# EAGLE board 1700-0003_PowerBoard_REV-A (EAGLE 7.7.0)
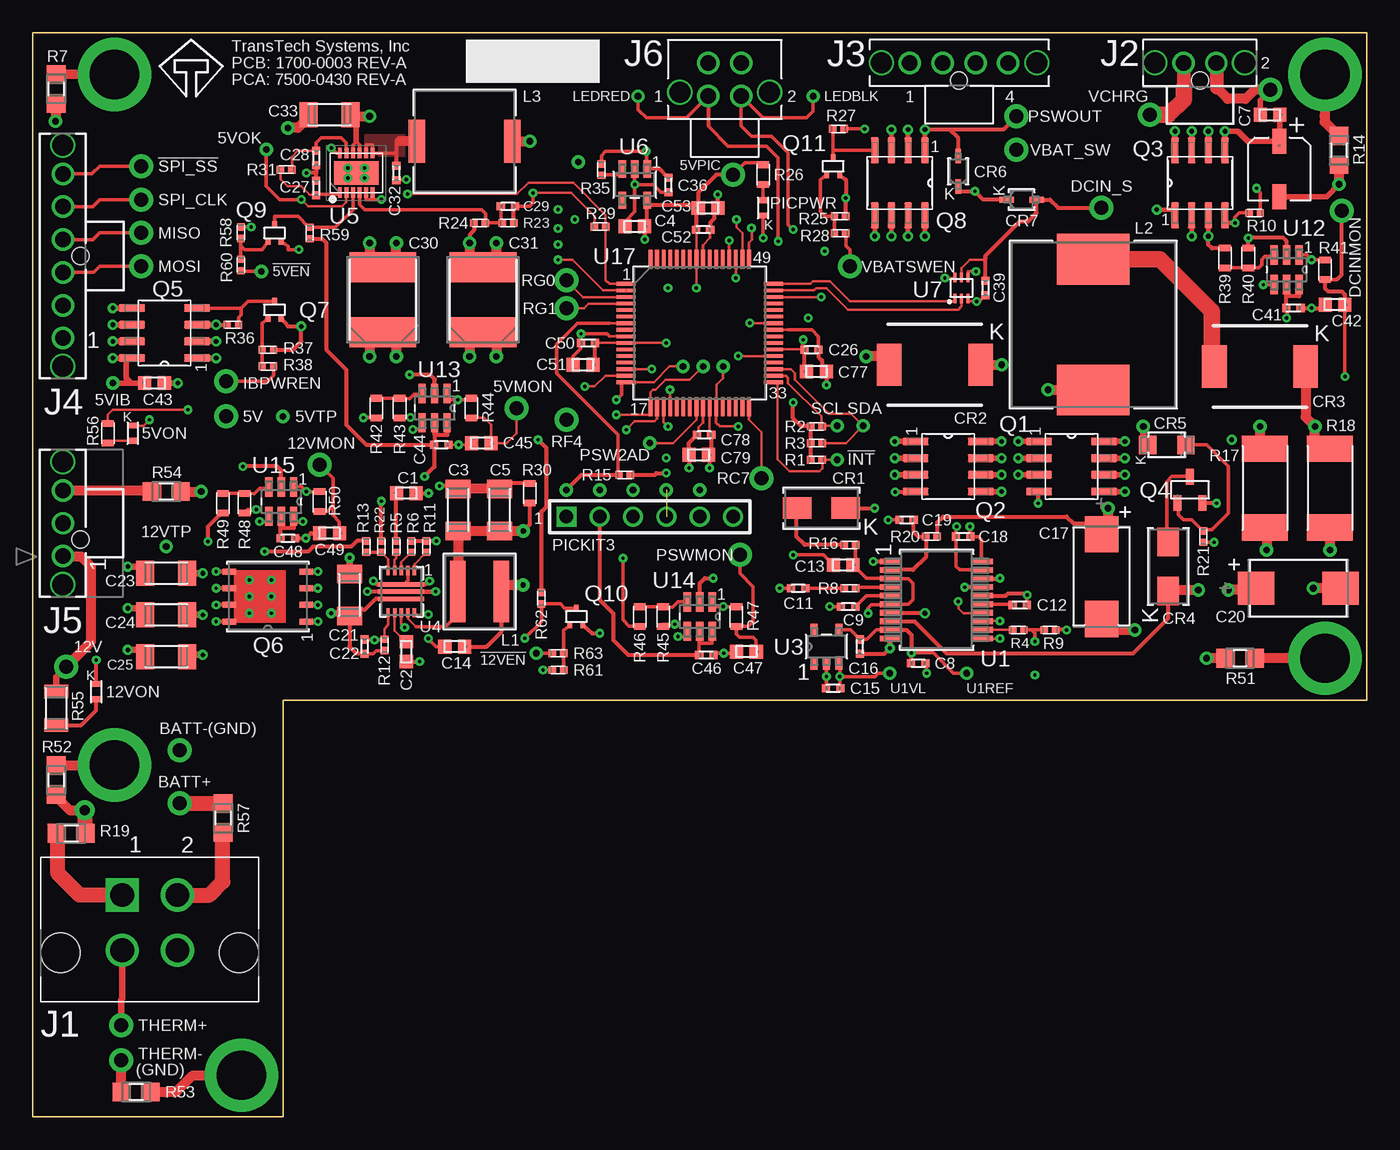
[diagram p7: board, top side]
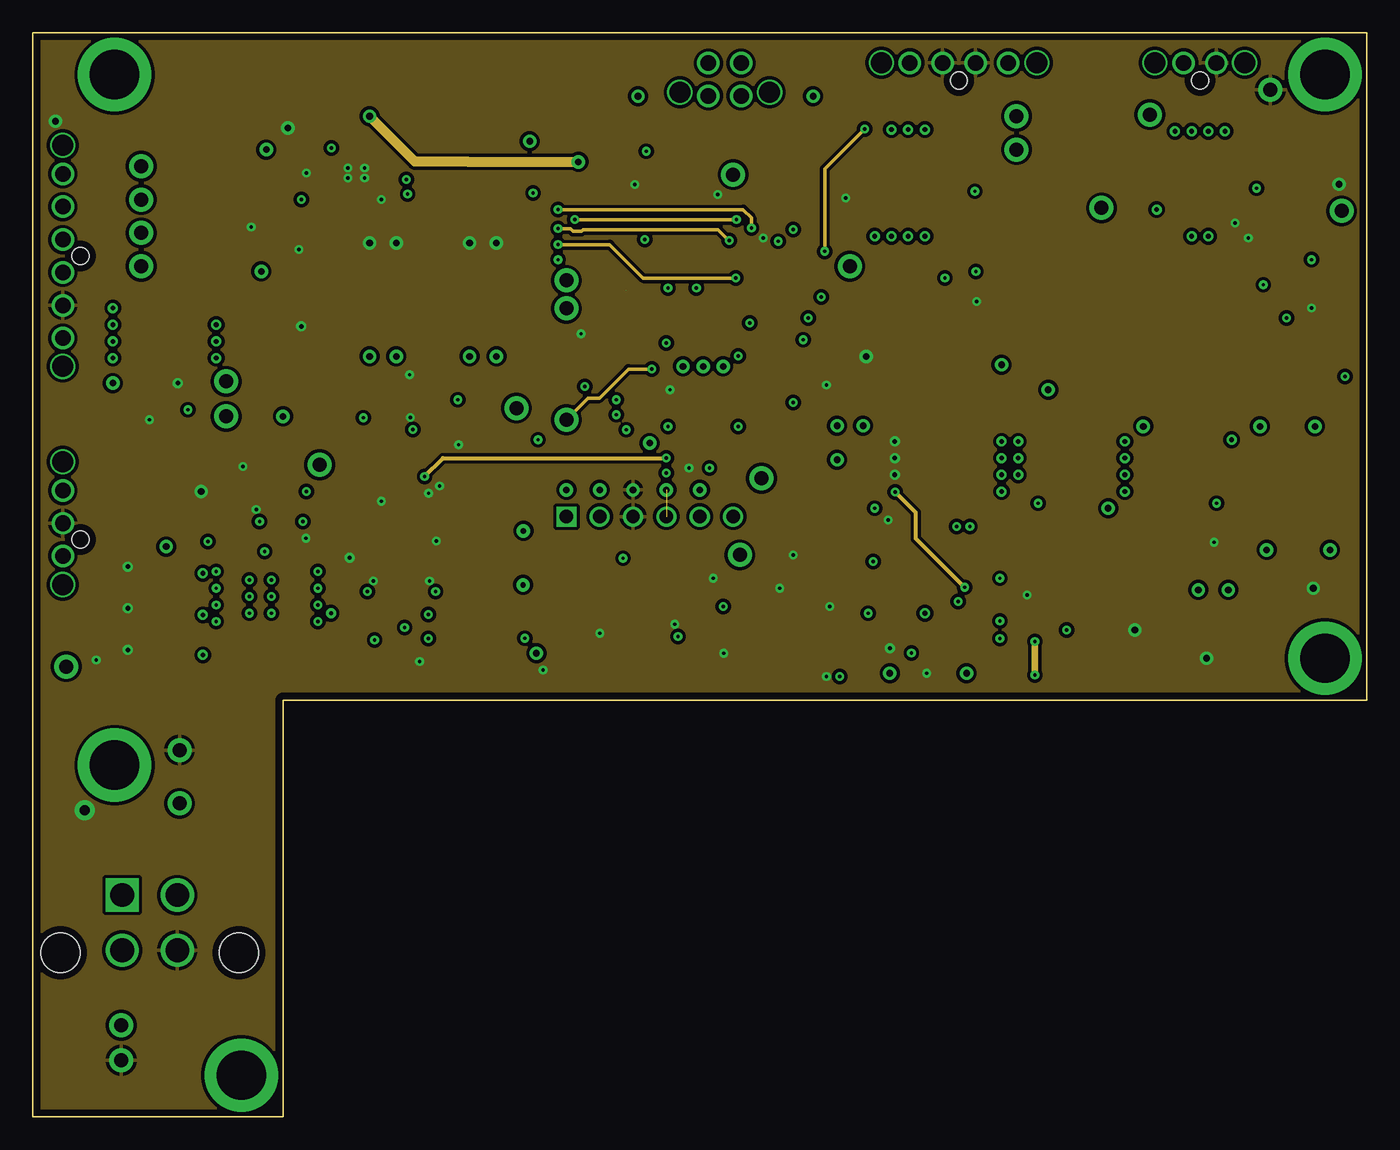
[diagram p8: board, inner layer GND+Signal]
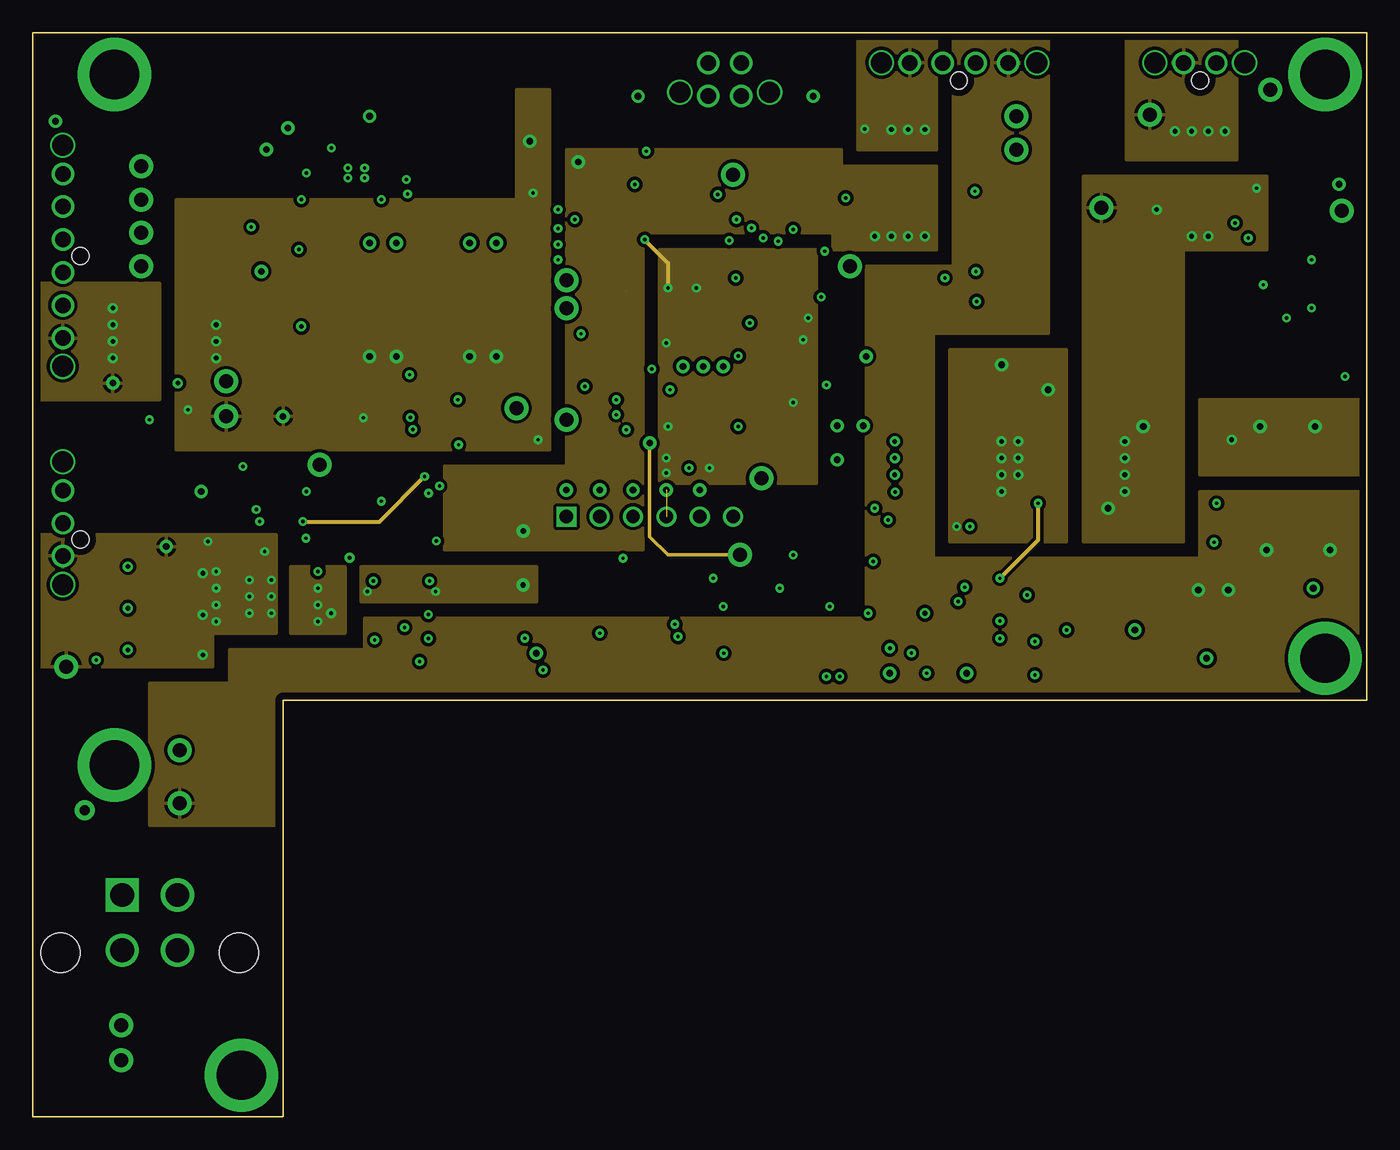
[diagram p9: board, inner layer PWR+Signal]
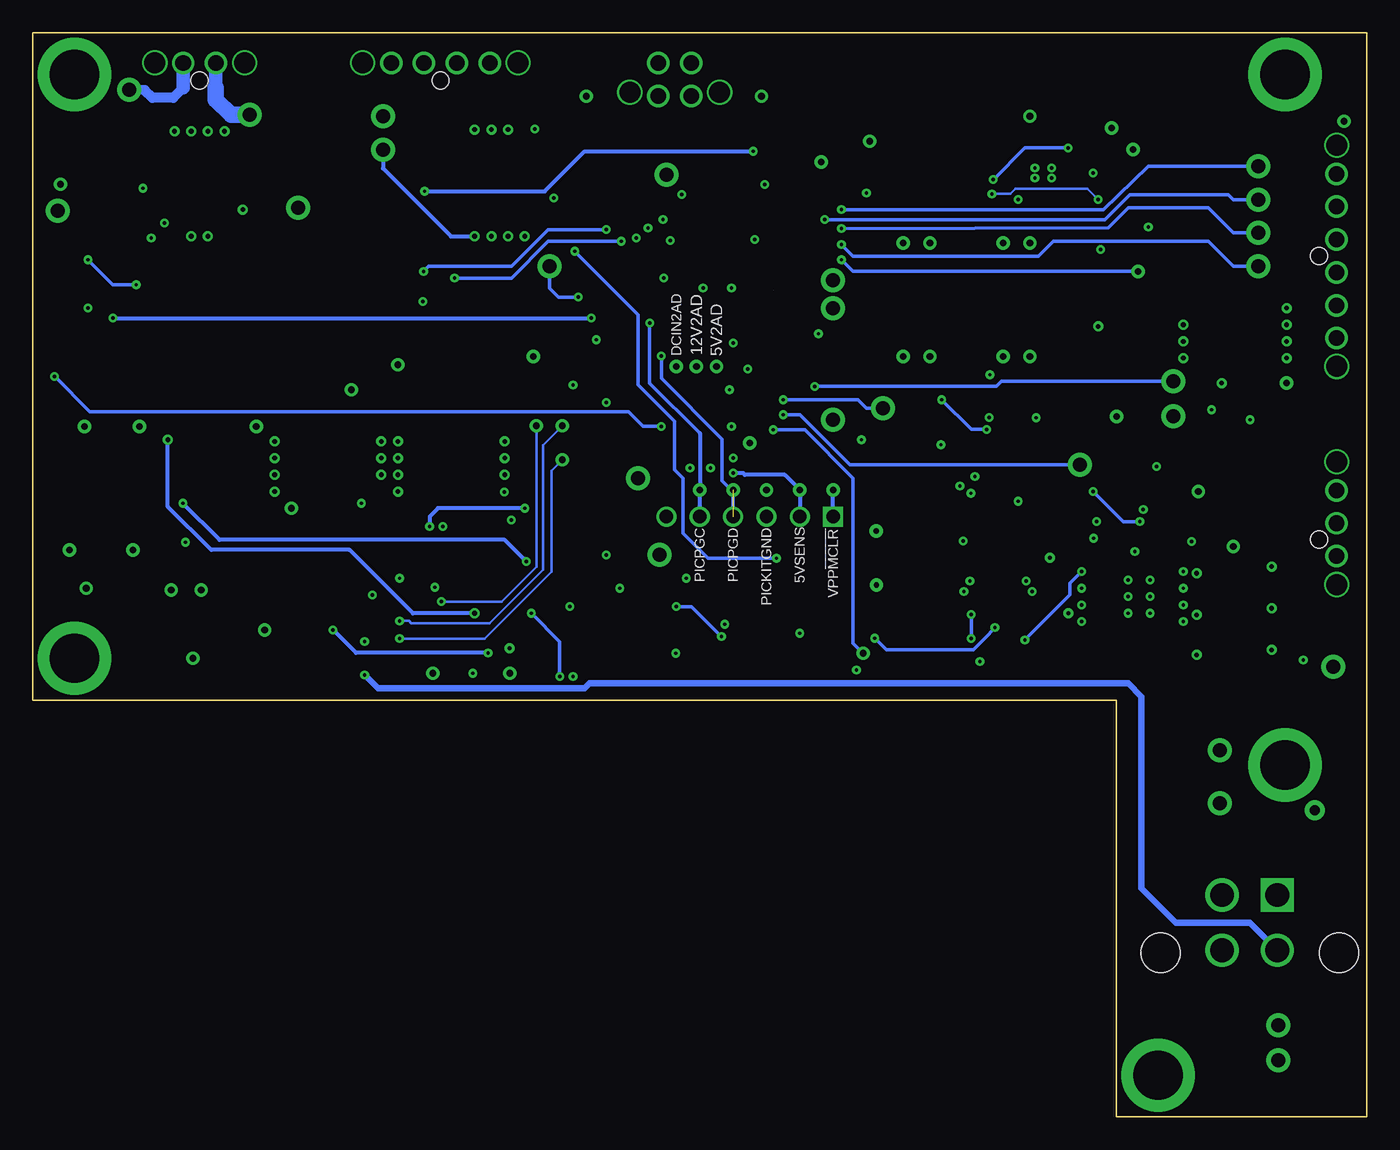
[diagram p10: board, bottom side, seen from below]

Size 101.6 x 82.55 mm. Coordinates in mm from the lower left corner, seen from the top.
Outline: 101.6,82.55 101.6,31.75 19.05,31.75 19.05,0 0,0 0,82.55 101.6,82.55
Copper layers (1+2*15+16): Top 0.035mm / dielectric 0.11mm / GND+Signal 0.035mm / dielectric 1.2mm / PWR+Signal 0.035mm / dielectric 0.11mm / Bottom 0.035mm
Design rules "default *": minimum track width 6mil, minimum drill 8mil, track to track 6mil, track to pad 6mil, pad to pad 6mil, via to via 6mil, smd to smd 0mil, copper to edge 20mil, drill to drill 10mil, minimum pad ring 6mil, minimum via ring 8mil, stop-mask expansion 2mil, vias tented up to drill 0mil, thermal gap 10mil
Net classes: 0 default: width 0.152 mm, drill 0.203 mm, clearance 0.254 mm

## Footprints (pad centres in the part's own frame; a part is rotated, then mirrored left to right if it is on the bottom)
TST_POINT_PTH_042-OCT = drill 1.067 pad 1.829: P$1 0,0
TST_POINT_PTH_20X40MIL = drill 0.508 pad 1.016: P$1 0,0
TST_POINT_PTH_20X40MIL_2PIN = drill 0.508 pad 1.016: P$1 0,0; P$2 0,0
LED_DIALIGHT_598_DIA = smd 0.445 x 0.711: 1 -0.578,0; 2 0.578,0
TST_POINT_PTH_042-OCT_2PIN = drill 1.067 pad 1.829: P$1 0,0; P$2 0,0
CAP_C1608_TDK = smd 1 x 1.05: 1 -0.75,0; 2 0.75,0
CAP_CL31_SAM = smd 1.4 x 1.9: 1 -1.6,0; 2 1.6,0
CAP_AFK106M25B12T-F_CND-L = smd 1.905 x 1.067: 1 -2.108,0; 2 2.108,0
G-155_MUR = smd 0.62 x 0.62: 1 -0.546,0; 2 0.546,0
CAPMP7.6X4.3_3.1N_KEM = smd 2.77 x 2.55: 1 -3.22,0; 2 3.22,0
CAP_CKG57N_TDK = smd 2.286 x 5.08: 1 -2.477,0; 2 2.477,0
SMA_DIO = smd 2.18 x 1.63: 1 -1.857,0; 2 1.857,0
CR_0CQ-13-F_DIO = smd 1.88 x 3.226: 1 -3.48,0; 2 3.48,0
DIO_BZD27C4V3P_VIS = smd 1.3 x 1.4: 1 -1.45,0; 2 1.45,0
USC_TOS = smd 1.111 x 0.451: 1 -1.15,0; 2 1.15,0
MOLEX_462075004 = drill 1.8 pad 2.54 square: 1 0,0 | drill 1.8 pad 2.54: 2 -4.2,0; 3 0,4.2; 4 -4.2,4.2 | hole 3: -8.9,4.391; 4.7,4.391
CON_1053111302_MOL = drill 1.194 pad 1.702: 1 -1.245,0; 2 1.245,0 | drill 1.6 pad 1.905: P1 -3.429,0; P2 3.404,0 | hole 1.295: 0,-1.346
CON_1053111304_MOL = drill 1.194 pad 1.702: 1 0,0; 2 2.489,0; 3 5.004,0; 4 7.493,0 | drill 1.6 pad 1.905: P1 -2.159,0; P2 9.677,0 | hole 1.295: 3.734,-1.346
CON_1053111206_MOL = drill 1.194 pad 1.702: 1 0,0; 2 2.489,0; 3 5.004,0; 4 7.493,0; 5 10.008,0; 6 12.497,0 | drill 1.6 pad 1.905: P1 -2.159,0; P2 14.681,0 | hole 1.295: 6.248,-1.346
CON_1053111303_MOL = drill 1.194 pad 1.702: 1 -2.489,0; 2 0,0; 3 2.489,0 | drill 1.6 pad 1.905: P1 -4.674,0; P2 4.674,0 | hole 1.295: -1.245,-1.346
CON_1053121304 = drill 1.194 pad 1.702: 1 -1.25,-1.25; 2 1.25,-1.25; 3 -1.25,1.25; 4 1.25,1.25 | drill 1.6 pad 1.905: P1 -3.42,-0.971; P2 3.42,-0.971
IND_XAL50XX_COC = smd 1.168 x 4.699: 1 -1.651,0; 2 1.651,0
DR127 = smd 3.861 x 5.512: 1 -4.978,0; 2 4.978,0
IND_CB_DRA74 = smd 1.257 x 3.251: 1 -3.626,0; 2 3.626,0
CON6_1X6_VERT-HDR = drill 1.016 pad 1.524 square: 1 -6.35,0 | drill 1.016 pad 1.524: 2 -3.81,0; 3 -1.27,0; 4 1.27,0; 5 3.81,0; 6 6.35,0
PTH_4-40 = drill 3.759 pad 5.588: P$1 0,0
SOIC127P600X175-8N = smd 1.97 x 0.59: 1 -2.475,1.905; 2 -2.475,0.635; 3 -2.475,-0.635; 4 -2.475,-1.905; 5 2.475,-1.905; 6 2.475,-0.635; 7 2.475,0.635; 8 2.475,1.905
SOT-23-3_DIOTEC = smd 0.6 x 1.2: 1 -0.95,-1; 2 0.95,-1; 3 0,1
SON8_SI7135DP-T1-GE3_VIS = smd 1.016 x 0.457: 1 -2.921,1.905; 2 -2.921,0.635; 3 -2.921,-0.635; 4 -2.921,-1.905; 5 2.921,-1.905; 6 2.921,-0.635; 7 2.921,0.635; 8 2.921,1.905
SC-75(SOT-416)_ONSEMI = smd 0.356 x 0.508: 1 -0.495,-0.648; 2 0.495,-0.648; 3 0,0.648
RESC1005X35N = smd 0.56 x 0.6: 1 -0.435,0; 2 0.435,0
STA_HCJ0805_STP = smd 1.4 x 1.44: 1 -1.1,0; 2 1.1,0
RES_2512_TECONN = smd 2 x 3.5: 1 -3,0; 2 3,0
STA_RMCF0603_STP = smd 0.5 x 0.9: 1 -0.75,0; 2 0.75,0
RC1206N_YAG = smd 1.041 x 1.803: 1 -1.27,0; 2 1.27,0
21-0056C_20_MXM = smd 1.613 x 0.432: 1 -3.499,2.925; 2 -3.499,2.275; 3 -3.499,1.625; 4 -3.499,0.975; 5 -3.499,0.325; 6 -3.499,-0.325; 7 -3.499,-0.975; 8 -3.499,-1.625; 9 -3.499,-2.275; 10 -3.499,-2.925; 11 3.499,-2.925; 12 3.499,-2.275; 13 3.499,-1.625; 14 3.499,-0.975; 15 3.499,-0.325; 16 3.499,0.325; 17 3.499,0.975; 18 3.499,1.625; 19 3.499,2.275; 20 3.499,2.925
UJ_5_ADI = smd 0.953 x 0.508: 1 -1.276,0.95; 2 -1.276,0; 3 -1.276,-0.95; 4 1.276,-0.95; 5 1.276,0.95
RNW0013A = smd 0.7 x 0.25: 1 -1.6,1; 2 -1.6,0.5; 3 -1.6,0; 4 -1.6,-0.5; 5 -1.6,-1; 9 1.6,-1; 10 1.6,-0.5; 11 1.6,0; 12 1.6,0.5; 13 1.6,1 | smd 0.35 x 3.5: 6 -0.55,0; 7 0,0; 8 0.55,0
SON50P300X400X90-13N = smd 0.8 x 0.3: 1 -1.5,1.25; 2 -1.5,0.75; 3 -1.5,0.25; 4 -1.5,-0.25; 5 -1.5,-0.75; 6 -1.5,-1.25; 7 1.5,-1.25; 8 1.5,-0.75; 9 1.5,-0.25; 10 1.5,0.25; 11 1.5,0.75; 12 1.5,1.25 | smd 1.8 x 3.4: 13 0,0
SOT23-5L_STM = smd 1.321 x 0.559: 1 -1.194,0.95; 2 -1.194,0; 3 -1.194,-0.95; 4 1.194,-0.95; 5 1.194,0.95
SOT5X3-6_DRL_TEX = smd 0.711 x 0.229: 1 -0.8,0.5; 2 -0.8,0; 3 -0.8,-0.5; 4 0.8,-0.5; 5 0.8,0; 6 0.8,0.5
DBV6 = smd 1.473 x 0.559: 1 -1.118,0.95; 2 -1.118,0; 3 -1.118,-0.95; 4 1.118,-0.95; 5 1.118,0; 6 1.118,0.95
TQFP64_10X10MC_MCH = smd 1.462 x 0.279: 1 -5.613,3.75; 2 -5.613,3.25; 3 -5.613,2.75; 4 -5.613,2.25; 5 -5.613,1.75; 6 -5.613,1.25; 7 -5.613,0.75; 8 -5.613,0.25; 9 -5.613,-0.25; 10 -5.613,-0.75; 11 -5.613,-1.25; 12 -5.613,-1.75; 13 -5.613,-2.25; 14 -5.613,-2.75; 15 -5.613,-3.25; 16 -5.613,-3.75; 33 5.613,-3.75; 34 5.613,-3.25; 35 5.613,-2.75; 36 5.613,-2.25; 37 5.613,-1.75; 38 5.613,-1.25; 39 5.613,-0.75; 40 5.613,-0.25; 41 5.613,0.25; 42 5.613,0.75; 43 5.613,1.25; 44 5.613,1.75; 45 5.613,2.25; 46 5.613,2.75; 47 5.613,3.25; 48 5.613,3.75 | smd 0.279 x 1.462: 17 -3.75,-5.613; 18 -3.25,-5.613; 19 -2.75,-5.613; 20 -2.25,-5.613; 21 -1.75,-5.613; 22 -1.25,-5.613; 23 -0.75,-5.613; 24 -0.25,-5.613; 25 0.25,-5.613; 26 0.75,-5.613; 27 1.25,-5.613; 28 1.75,-5.613; 29 2.25,-5.613; 30 2.75,-5.613; 31 3.25,-5.613; 32 3.75,-5.613; 49 3.75,5.613; 50 3.25,5.613; 51 2.75,5.613; 52 2.25,5.613; 53 1.75,5.613; 54 1.25,5.613; 55 0.75,5.613; 56 0.25,5.613; 57 -0.25,5.613; 58 -0.75,5.613; 59 -1.25,5.613; 60 -1.75,5.613; 61 -2.25,5.613; 62 -2.75,5.613; 63 -3.25,5.613; 64 -3.75,5.613

## Placement (x,y rotation side)
5V  TST_POINT_PTH_042-OCT  [TST_POINT_PTH_042-OCT]  14.73,53.34 0 top
5V2AD  TST_POINT_PTH_20X40MIL  [TST_POINT_PTH_20X40MIL]  49.53,57.15 0 top
5VIB  TST_POINT_PTH_20X40MIL  [TST_POINT_PTH_20X40MIL]  6.1,55.88 0 top
5VMON  TST_POINT_PTH_042-OCT  [TST_POINT_PTH_042-OCT]  36.83,53.98 0 top
5VOK  TST_POINT_PTH_20X40MIL_2PIN  [TST_POINT_PTH_20X40MIL_2PIN]  17.78,73.66 0 top
5VON  GRN/2.7V/2mA  [LED_DIALIGHT_598_DIA]  7.62,52.07 270 top
5VPIC  TST_POINT_PTH_042-OCT  [TST_POINT_PTH_042-OCT]  53.34,71.75 0 top
5VSENS  TST_POINT_PTH_20X40MIL_2PIN  [TST_POINT_PTH_20X40MIL_2PIN]  43.18,47.75 90 top
5VTP  TST_POINT_PTH_20X40MIL  [TST_POINT_PTH_20X40MIL]  19.05,53.34 0 top
12V  TST_POINT_PTH_042-OCT  [TST_POINT_PTH_042-OCT]  2.54,34.29 0 top
12V2AD  TST_POINT_PTH_20X40MIL  [TST_POINT_PTH_20X40MIL]  51.05,57.15 0 top
12VMON  TST_POINT_PTH_042-OCT  [TST_POINT_PTH_042-OCT]  21.84,49.66 0 top
12VON  GRN/2.7V/2mA  [LED_DIALIGHT_598_DIA]  4.83,32.38 270 top
12VTP  TST_POINT_PTH_20X40MIL  [TST_POINT_PTH_20X40MIL]  10.16,43.43 0 top
!5VEN  TST_POINT_PTH_20X40MIL_2PIN  [TST_POINT_PTH_20X40MIL_2PIN]  17.4,64.39 0 top
!12VEN  TST_POINT_PTH_20X40MIL  [TST_POINT_PTH_20X40MIL]  38.35,35.31 0 top
!INT!  TST_POINT_PTH_20X40MIL_2PIN  [TST_POINT_PTH_20X40MIL_2PIN]  61.26,50.04 0 top
!SPI_SS!  TST_POINT_PTH_042_2PIN  [TST_POINT_PTH_042-OCT_2PIN]  8.26,72.39 0 top
BATT+  TST_POINT_PTH_042-OCT  [TST_POINT_PTH_042-OCT]  11.18,23.88 0 top
BATT-(GND)  TST_POINT_PTH_042-OCT  [TST_POINT_PTH_042-OCT]  11.18,27.94 0 top
C1  220pF (0603)  [CAP_C1608_TDK]  28.45,47.5 0 top
C2  4.7/16V (0603)  [CAP_C1608_TDK]  28.45,35.43 270 top
C3  22/25V (1206)  [CAP_CL31_SAM]  32.38,46.23 90 top
C4  4.7/16V (0603)  [CAP_C1608_TDK]  45.85,67.82 180 top
C5  22/25V (1206)  [CAP_CL31_SAM]  35.56,46.23 90 top
C6  10/25  [CAP_AFK106M25B12T-F_CND-L]  94.95,72.19 270 top
C7  0.1/50V  [CAP_C1608_TDK]  94.23,76.3 180 top
C8  0.1 (0402)  [G-155_MUR]  67.44,34.54 0 top
C9  47nF (0402)  [G-155_MUR]  62.1,38.86 180 top
C11  0.1 (0402)  [G-155_MUR]  58.29,40.26 180 top
C12  22nF (0402)  [G-155_MUR]  75.18,38.99 0 top
C13  1/25V  [CAP_C1608_TDK]  61.72,42.04 180 top
C14  0.1/50V  [CAP_C1608_TDK]  32.13,35.81 180 top
C15  0.1 (0402)  [G-155_MUR]  60.96,32.64 180 top
C16  0.1 (0402)  [G-155_MUR]  62.99,35.81 270 top
C17  22/35 (2917)  [CAPMP7.6X4.3_3.1N_KEM]  81.41,41.15 270 top
C18  0.1 (0402)  [G-155_MUR]  70.87,44.2 180 top
C19  0.1 (0402)  [G-155_MUR]  66.55,45.47 180 top
C20  47/25  [CAPMP7.6X4.3_3.1N_KEM]  96.39,40.26 0 top
C21  10/50V (1206)  [CAP_CL31_SAM]  24.13,39.75 90 top
C22  22nF/25V (0402)  [G-155_MUR]  25.27,35.81 90 top
C23  22/25V (1206)  [CAP_CL31_SAM]  10.16,41.4 180 top
C24  22/25V (1206)  [CAP_CL31_SAM]  10.16,38.23 180 top
C25  22/25V (1206)  [CAP_CL31_SAM]  10.16,35.05 180 top
C26  0.1/16V (0402)  [G-155_MUR]  59.31,58.42 0 top
C27  DNP (0402)  [G-155_MUR]  21.59,70.74 90 top
C28  1/25V (0402)  [G-155_MUR]  21.59,73.03 270 top
C29  12pF (0402)  [G-155_MUR]  36.2,69.34 180 top
C30  47/50V (MLCC-SMD)  [CAP_CKG57N_TDK]  26.67,62.23 90 top
C31  47/50V  [CAP_CKG57N_TDK]  34.29,62.23 90 top
C32  0.1 (0402)  [G-155_MUR]  27.69,71.88 270 top
C33  22/25V (1206)  [CAP_CL31_SAM]  22.61,76.33 180 top
C36  1/10V (0402)  [G-155_MUR]  48.41,70.97 270 top
C39  0.1 (0402)  [G-155_MUR]  72.57,63.12 270 top
C41  0.1 (0402)  [G-155_MUR]  96.01,61.59 0 top
C42  0.1/25V (0603)  [CAP_C1608_TDK]  99.19,61.85 180 top
C43  10/10V (0603)  [CAP_C1608_TDK]  9.27,55.88 0 top
C44  0.1 (0402)  [G-155_MUR]  31.11,51.18 0 top
C45  0.1/25V (0603)  [CAP_C1608_TDK]  34.16,51.31 180 top
C46  0.1 (0402)  [G-155_MUR]  51.31,35.18 0 top
C47  0.1/25V (0603)  [CAP_C1608_TDK]  54.36,35.43 180 top
C48  0.1 (0402)  [G-155_MUR]  19.43,44.07 0 top
C49  0.1/25V (0603)  [CAP_C1608_TDK]  22.61,44.45 180 top
C50  0.1/16V (0402)  [G-155_MUR]  42.29,58.93 180 top
C51  10/10V (0603)  [CAP_C1608_TDK]  41.91,57.28 180 top
C52  0.1/16V (0402)  [G-155_MUR]  51.05,67.56 0 top
C53  10/10V (0603)  [CAP_C1608_TDK]  51.44,69.22 0 top
C77  10/10V (0603)  [CAP_C1608_TDK]  59.69,56.77 0 top
C78  0.1/16V (0402)  [G-155_MUR]  51.13,51.94 180 top
C79  10/10V (0603)  [CAP_C1608_TDK]  50.72,50.42 180 top
CR1  1A/50V  [SMA_DIO]  60.07,46.35 180 top
CR2  5A/60V/SMC  [CR_0CQ-13-F_DIO]  68.71,57.28 0 top
CR3  5A/60V/SMC  [CR_0CQ-13-F_DIO]  93.47,57.15 0 top
CR4  1A/50V  [SMA_DIO]  86.49,41.91 90 top
CR5  4.3V/0.8W/DO219AB  [DIO_BZD27C4V3P_VIS]  86.36,51.18 180 top
CR6  0.3A/20V  [USC_TOS]  70.48,72.01 90 top
CR7  0.3A/20V  [USC_TOS]  75.31,69.85 0 top
DCIN2AD  TST_POINT_PTH_20X40MIL  [TST_POINT_PTH_20X40MIL]  52.58,57.15 0 top
DCIN_S  TST_POINT_PTH_042-OCT  [TST_POINT_PTH_042-OCT]  81.41,69.22 0 top
DCINMON  TST_POINT_PTH_042-OCT  [TST_POINT_PTH_042-OCT]  99.69,68.99 0 top
GND  TST_POINT_PTH_042-OCT  [TST_POINT_PTH_042-OCT]  94.26,78.21 0 top
IBPWREN  TST_POINT_PTH_042-OCT  [TST_POINT_PTH_042-OCT]  14.73,56.01 0 top
J1  MOLEX_MINI-FIT-JR_462075004  [MOLEX_462075004]  6.81,16.89 180 top
J2  MOLEX_NANO-FIT_1053111302  [CON_1053111302_MOL]  88.9,80.26 0 top
J3  MOLEX_NANO-FIT_1053111304  [CON_1053111304_MOL]  66.8,80.26 0 top
J4  MOLEX_1053111206  [CON_1053111206_MOL]  2.29,59.31 90 top
J5  MOLEX_NANO-FIT_1053111303  [CON_1053111303_MOL]  2.29,45.21 90 top
J6  CON_MOLEX_NANOFIT_1053121304  [CON_1053121304]  52.7,78.99 0 top
L1  1.2uH/11.1A/9.4mOhm  [IND_XAL50XX_COC]  34.04,40.01 180 top
L2  22uH/4A/39mOhm  [DR127]  80.77,60.33 90 top
L3  3.3uH/4.2A  [IND_CB_DRA74]  32.89,74.3 180 top
LEDBLK  TST_POINT_PTH_20X40MIL  [TST_POINT_PTH_20X40MIL]  59.44,77.72 0 top
LEDRED  TST_POINT_PTH_20X40MIL  [TST_POINT_PTH_20X40MIL]  46.1,77.72 0 top
MISO  TST_POINT_PTH_042_2PIN  [TST_POINT_PTH_042-OCT_2PIN]  8.26,67.31 0 top
MOSI  TST_POINT_PTH_042_2PIN  [TST_POINT_PTH_042-OCT_2PIN]  8.26,64.77 0 top
PICKIT3  CON_6POS_VERT-HDR_AMPH_10129378-906001  [CON6_1X6_VERT-HDR]  46.99,45.72 0 top
PICKITGND  TST_POINT_PTH_20X40MIL_2PIN  [TST_POINT_PTH_20X40MIL_2PIN]  45.72,47.75 90 top
PICPGC  TST_POINT_PTH_20X40MIL_2PIN  [TST_POINT_PTH_20X40MIL_2PIN]  50.8,47.75 90 top
PICPGD  TST_POINT_PTH_20X40MIL_2PIN  [TST_POINT_PTH_20X40MIL_2PIN]  48.26,47.75 90 top
PICPWR  GRN/2.7V/2mA  [LED_DIALIGHT_598_DIA]  55.63,69.22 90 top
PSW2AD  TST_POINT_PTH_20X40MIL  [TST_POINT_PTH_20X40MIL]  46.99,51.31 0 top
PSWMON  TST_POINT_PTH_042-OCT  [TST_POINT_PTH_042-OCT]  53.85,42.8 0 top
PSWOUT  TST_POINT_PTH_042-OCT  [TST_POINT_PTH_042-OCT]  74.93,76.2 180 top
PTH1  PTH_4-40  [PTH_4-40]  6.22,79.38 0 top
PTH2  PTH_4-40  [PTH_4-40]  98.42,79.38 0 top
PTH3  PTH_4-40  [PTH_4-40]  98.42,34.92 0 top
PTH4  PTH_4-40  [PTH_4-40]  6.22,26.8 0 top
PTH5  PTH_4-40  [PTH_4-40]  15.88,3.17 0 top
Q1  N-CH/30V/11A/8-SOIC  [SOIC127P600X175-8N]  79.12,49.53 0 top
Q2  N-CH/30V/11A/8-SOIC  [SOIC127P600X175-8N]  69.72,49.53 0 top
Q3  P-CH/40V/10A/8-SOIC  [SOIC127P600X175-8N]  88.9,71.12 90 top
Q4  45V/0.8A/SOT23  [SOT-23-3_DIOTEC]  88.14,47.75 0 top
Q5  P-CH/40V/10A/8-SOIC  [SOIC127P600X175-8N]  10.03,59.69 180 top
Q6  P-CH/-30V/-60A/PPAK/SO-8  [SON8_SI7135DP-T1-GE3_VIS]  17.91,39.62 180 top
Q7  NPN/40V/0.6A/SC75  [SC-75(SOT-416)_ONSEMI]  18.41,61.47 0 top
Q8  P-CH/40V/10A/8-SOIC  [SOIC127P600X175-8N]  66.04,71.12 270 top
Q9  NPN/40V/0.6A/SC75  [SC-75(SOT-416)_ONSEMI]  18.41,67.31 0 top
Q10  NPN/40V/0.6A/SC75  [SC-75(SOT-416)_ONSEMI]  41.4,38.1 0 top
Q11  NPN/40V/0.6A/SC75  [SC-75(SOT-416)_ONSEMI]  60.96,72.39 0 top
R1  10K (0402)  [RESC1005X35N]  59.69,50.04 0 top
R2  10K (0402)  [RESC1005X35N]  59.69,52.58 0 top
R3  10K (0402)  [RESC1005X35N]  59.69,51.31 0 top
R4  10K (0402)  [RESC1005X35N]  75.06,37.08 180 top
R5  133K (0402)  [RESC1005X35N]  27.69,43.43 90 top
R6  86.6K (0402)  [RESC1005X35N]  28.83,43.43 90 top
R7  0 (0805)  [STA_HCJ0805_STP]  1.78,78.28 270 top
R8  10K (0402)  [RESC1005X35N]  62.23,40.26 0 top
R9  10K (0402)  [RESC1005X35N]  77.47,37.08 180 top
R10  10K (0402)  [RESC1005X35N]  93.07,68.83 0 top
R11  174K (0402)  [RESC1005X35N]  29.97,43.43 90 top
R12  133K (0402)  [RESC1005X35N]  26.8,35.94 90 top
R13  732K (0402)  [RESC1005X35N]  25.4,43.43 270 top
R14  0 (0805)  [STA_HCJ0805_STP]  99.49,73.61 270 top
R15  10K (0402)  [RESC1005X35N]  45.09,48.9 180 top
R16  10 (0402)  [RESC1005X35N]  62.23,43.56 180 top
R17  0.09/2W/2512  [RES_2512_TECONN]  93.85,47.88 270 top
R18  0.09/2W/2512  [RES_2512_TECONN]  98.81,47.88 270 top
R19  0 (0805)  [STA_HCJ0805_STP]  2.92,21.59 180 top
R20  10 (0402)  [RESC1005X35N]  68.45,44.2 0 top
R21  10K (0402)  [RESC1005X35N]  89.15,44.2 270 top
R22  80.6K (0402)  [RESC1005X35N]  26.54,43.43 90 top
R23  499K/0.1%  [RESC1005X35N]  36.2,68.07 180 top
R24  95.3K/0.1%  [RESC1005X35N]  34.04,68.07 180 top
R25  10K (0402)  [RESC1005X35N]  61.49,68.58 180 top
R26  1.15K  [STA_RMCF0603_STP]  55.63,71.75 90 top
R27  10K (0402)  [RESC1005X35N]  61.37,75.23 0 top
R28  1K (0402)  [RESC1005X35N]  61.49,67.28 180 top
R29  10K (0402)  [RESC1005X35N]  43.21,67.79 0 top
R30  10K, 0.1%  [STA_RMCF0603_STP]  37.85,47.5 90 top
R31  DNP (0402)  [RESC1005X35N]  19.3,72.14 180 top
R35  10K (0402)  [RESC1005X35N]  43.31,72.14 90 top
R36  10K (0402)  [RESC1005X35N]  15.24,60.33 180 top
R37  10K (0402)  [RESC1005X35N]  17.91,58.42 180 top
R38  1K (0402)  [RESC1005X35N]  17.91,57.15 180 top
R39  30K, 0.1%  [STA_RMCF0603_STP]  90.81,65.41 270 top
R40  10K, 0.1%  [STA_RMCF0603_STP]  92.58,65.41 90 top
R41  100  [STA_RMCF0603_STP]  98.42,64.52 270 top
R42  10K, 0.1%  [STA_RMCF0603_STP]  26.16,53.98 90 top
R43  15K, 0.1%  [STA_RMCF0603_STP]  27.94,53.98 270 top
R44  100  [STA_RMCF0603_STP]  33.4,53.98 270 top
R45  10K, 0.1%  [STA_RMCF0603_STP]  48.01,38.1 270 top
R46  18K, 0.1%  [STA_RMCF0603_STP]  46.23,38.1 90 top
R47  100  [STA_RMCF0603_STP]  53.59,38.1 270 top
R48  10K, 0.1%  [STA_RMCF0603_STP]  16.13,46.74 270 top
R49  30K, 0.1%  [STA_RMCF0603_STP]  14.48,46.74 90 top
R50  100  [STA_RMCF0603_STP]  21.84,46.86 270 top
R51  0 (0805)  [STA_HCJ0805_STP]  91.95,34.92 180 top
R52  0 (0805)  [STA_HCJ0805_STP]  1.78,25.65 270 top
R53  0 (0805)  [STA_HCJ0805_STP]  7.87,1.91 180 top
R54  0 (0805)  [STA_HCJ0805_STP]  10.16,47.62 0 top
R55  4.64K  [RC1206N_YAG]  1.78,31.11 270 top
R56  1.15K  [STA_RMCF0603_STP]  5.71,52.07 90 top
R57  0 (0805)  [STA_HCJ0805_STP]  14.5,22.76 270 top
R58  10K (0402)  [RESC1005X35N]  15.85,67.34 270 top
R59  10K (0402)  [RESC1005X35N]  21.08,67.31 270 top
R60  1K (0402)  [RESC1005X35N]  15.85,64.87 90 top
R61  10K (0402)  [RESC1005X35N]  40.01,34.04 0 top
R62  10K (0402)  [RESC1005X35N]  38.73,39.5 90 top
R63  1K (0402)  [RESC1005X35N]  40.01,35.31 0 top
RC7  TST_POINT_PTH_042-OCT  [TST_POINT_PTH_042-OCT]  55.5,48.64 0 top
RF4  TST_POINT_PTH_042-OCT  [TST_POINT_PTH_042-OCT]  40.64,53.09 0 top
RG0  TST_POINT_PTH_042-OCT  [TST_POINT_PTH_042-OCT]  40.64,63.7 0 top
RG1  TST_POINT_PTH_042-OCT  [TST_POINT_PTH_042-OCT]  40.64,61.57 0 top
SCL  TST_POINT_PTH_20X40MIL_2PIN  [TST_POINT_PTH_20X40MIL_2PIN]  61.26,52.63 0 top
SDA  TST_POINT_PTH_20X40MIL_2PIN  [TST_POINT_PTH_20X40MIL_2PIN]  63.25,52.63 0 top
SPI_CLK  TST_POINT_PTH_042_2PIN  [TST_POINT_PTH_042-OCT_2PIN]  8.26,69.85 0 top
THERM+  TST_POINT_PTH_042-OCT  [TST_POINT_PTH_042-OCT]  6.73,6.99 0 top
THERM-  TST_POINT_PTH_042-OCT  [TST_POINT_PTH_042-OCT]  6.73,4.32 0 top
U1  MAX1647EAP+  [21-0056C_20_MXM]  68.83,39.37 0 top
U1REF  TST_POINT_PTH_20X40MIL  [TST_POINT_PTH_20X40MIL]  71.12,33.78 0 top
U1VL  TST_POINT_PTH_20X40MIL  [TST_POINT_PTH_20X40MIL]  65.28,33.78 0 top
U3  AD_REFERENCE_ADR364AUJZ-REEL7  [UJ_5_ADI]  60.45,35.81 90 top
U4  REGULATOR_BOOST_TI_TPS61178RNWT  [RNW0013A]  28.07,40.01 270 top
U5  REGULATOR_BUCK_RENESAS_ISL85005AFRZ-T7A  [SON50P300X400X90-13N]  24.64,71.88 90 top
U6  IC_LDO_STM_LD2981CM50TR  [SOT23-5L_STM]  45.85,70.99 270 top
U7  IC_H-BRIDGE_TI_DRV8220DRLR  [SOT5X3-6_DRL_TEX]  70.74,63.12 90 top
U12  IC_OPAMP_TI_OPA363AIDBVR  [DBV6]  95.5,64.52 270 top
U13  IC_OPAMP_TI_OPA363AIDBVR  [DBV6]  30.61,53.98 270 top
U14  IC_OPAMP_TI_OPA363AIDBVR  [DBV6]  50.8,38.1 270 top
U15  IC_OPAMP_TI_OPA363AIDBVR  [DBV6]  18.92,46.86 270 top
U17  PIC18F6627T-E/PT  [TQFP64_10X10MC_MCH]  50.8,59.69 0 top
VBAT_SW  TST_POINT_PTH_042-OCT  [TST_POINT_PTH_042-OCT]  74.93,73.66 0 top
VBATSWEN  TST_POINT_PTH_042-OCT  [TST_POINT_PTH_042-OCT]  62.23,64.77 180 top
VCHRG  TST_POINT_PTH_042-OCT  [TST_POINT_PTH_042-OCT]  85.09,76.33 0 top
VPP!MCLR!  TST_POINT_PTH_20X40MIL_2PIN  [TST_POINT_PTH_20X40MIL_2PIN]  40.64,47.75 90 top

## Tracks (layer width: path | path; a pad name or v marks a point on that pad's centre or on a via)
5V  (via drill 0.25 pad 0.66, 0.36 pad 0.76, 0.51 pad 1.02)
  Top 0.203: R56.2 5.71,53.47 6.1,53.85 v11.81,53.85 | R29.1 42.77,68.58 41,70.36 v38.1,70.36
  Top 0.254: C29.1 37.85,69.34 38.1,69.6 v38.1,70.36
  Top 0.305: v13.97,60.33 R36.2 | R23.1 36.63,69.23 C29.1 | R42.1 arc-90 R42.1 v25.17,53.24 | R62.2 38.73,46.1 39.12,46.48 39.12,50.93 v38.48,51.56
  Top 0.406: Q5.1 v13.97,57.78 | Q5.2 v13.97,59.05 | Q5.3 v13.97,60.33
  Top 0.762: v25.65,57.91 25.65,59.69 C30.1 27.5,59.75 | 27.81,59.75 27.5,59.75 | 27.5,59.75 27.81,59.69 27.69,59.69 v27.69,57.91 | v35.31,57.91 35.31,59.75 C31.1 33.27,59.75 v33.27,57.91 | L3.1 v37.85,74.3
  pour PWR+Signal: 39.37,50.8 39.37,78.23 36.83,78.23 36.83,69.85 10.92,69.85 10.92,50.8
5V_MON  (via drill 0.25 pad 0.66)
  Top 0.203: 45.13,55.93 U17.16 47.3,55.94 48.51,57.15 5V2AD.P$1 | 5VMON.P$1 36.83,52.07 36.07,51.31 C45.1 34.9,52.7 34.35,53.25 R44.2
  Top 0.254: v44.45,54.61 44.83,54.99 44.83,55.94 U17.16
  Bottom 0.254: v44.45,54.61 38.73,54.61 38.1,53.98 5VMON.P$1
5V_OK  (via drill 0.25 pad 0.66)
  Top 0.203: U17.1 45.18,63.45 43.92,63.45 43.64,63.73 R29.2 43.64,68.68 41.17,71.14 37.74,71.14 36.88,70.28 v28.55,70.28 | v20.45,69.85 20.95,69.34 23.57,69.34 23.88,69.65 23.88,70.37 U5.2
  Top 0.254: 5VOK.P$1 17.78,70.87 18.8,69.85 v20.45,69.85
  Bottom 0.203: v28.55,70.28 27.15,70.28 26.77,70.66 21.26,70.66 v20.45,69.85
5VPIC  (via drill 0.25 pad 0.66)
  Top 0.203: C26.1 58.74,58.44 U17.38 | C77.1 58.76,56.95 | C52.1 50.55,67.52 U17.57 v50.55,63.12 | C53.1 50.51,69.04 | C50.1 U17.10 48.25,58.94 v48.26,58.93 | C51.1 42.84,57.45 | C78.1 51.55,52.07 U17.26 | U17.19 48.05,52.91 v48.39,52.58
  Top 0.254: C46.1 50.76,36.98 U14.5 50.8,36.07 51.74,36.07 U14.6 | v51.54,49.4 51.54,49.68 51.55,50.41 C79.1 51.47,50.56 51.66,50.75 | R26.2 55.63,72.64 54.23,72.64 5VPIC.P$1
  Top 0.305: U12.6 96.45,62.48 95.5,62.48 U12.5 95.47,63.4 C41.1 95.5,61.56 v95.5,60.83 | 58.76,56.95 C26.1 | 50.51,69.04 C52.1 | 42.84,57.45 C50.1 | C48.1 18.89,45.74 U15.5 18.92,44.83 19.87,44.83 U15.6 19.87,45.34 v20.57,45.34 | U13.6 31.56,51.92 30.61,51.92 U13.5 30.61,51.18 C44.1 | C79.1 51.55,50.75 | 51.66,50.75 51.66,50.77 51.68,50.79 C78.1 | R15.1 47.37,48.9 47.5,49.02 v48.26,49.02 | R1.1 R3.1 R2.1 58.55,52.58 57.91,53.21 v57.91,54.41 | v46.61,66.8 46.6,66.81 C4.1 46.8,67.82 U6.5 46.8,69.47 50.69,69.47 C53.1 50.67,69.23 50.67,70.36 52.07,71.75 5VPIC.P$1 | 58.74,58.44 58.67,58.44 v58.67,59.18 | C44.1 30.57,49.49 v29.84,48.77 | PICKIT3.2 43.18,39.37 44.2,38.35 44.2,36.32 45.34,35.18 C46.1 | R59.2 22.02,66.88 22.35,66.55 22.35,58.42 23.88,56.9 23.88,52.7 25.4,51.18 C44.1
  Top 0.406: 42.67,57.28 C51.1 42.55,57.28
  GND+Signal 0.305: v29.84,48.77 31.24,50.16 v48.26,50.16
  PWR+Signal 0.305: v46.61,66.8 48.39,65.02 v48.39,63.12 | v20.57,45.34 26.42,45.34 v29.84,48.77
  Bottom 0.305: v48.26,49.02 47.5,49.02 47.37,48.9 44.32,48.9 5VSENS.P$1 PICKIT3.2 | v95.5,60.83 v59.05,60.83
  pour PWR+Signal: 47.75,66.04 59.69,66.04 59.69,48.26 47.75,48.26
12V_MON  (via drill 0.25 pad 0.66)
  Top 0.203: 47.04,54.07 U17.17 | v44.45,53.47 47.05,53.47 U17.17 | U17.17 47.05,55.18 47.24,55.37 47.45,55.37 48.21,56.13 50.04,56.13 12V2AD.P$1
  Top 0.254: 22.86,46.53 22.86,45.82 23.34,45.34 23.34,44.46 C49.1 | 22.86,46.53 22.86,48.64 12VMON.P$1 | R50.2 22.46,46.14 22.86,46.53
  Bottom 0.254: 12VMON.P$1 39.37,49.66 43.18,53.47 v44.45,53.47
!5V_EN!  (via drill 0.25 pad 0.66)  (1 unrouted)
  Top 0.203: v40.01,65.28 41.1,65.28 43.43,62.94 U17.2
  Top 0.254: R60.1 15.85,64.39 !5VEN.P$1
  Bottom 0.254: v40.01,65.28 39.12,64.39 !5VEN.P$1
!12V_EN!  (via drill 0.25 pad 0.66)
  Top 0.203: v45.21,52.32 45.85,52.96 47.35,52.96 47.55,53.16 U17.18
  Top 0.254: R63.1 !12VEN.P$1
  Bottom 0.254: v45.21,52.32 42.8,52.32 39.12,48.64 39.12,36.07 !12VEN.P$1
!CHRGR_INT!  (via drill 0.25 pad 0.66)
  Top 0.203: U1.11 73.08,36.4 73.08,36.42 v73.66,36.42 | U17.33 56.72,55.94 56.72,50.06 57.63,49.15 59.92,49.15 60.15,49.38 60.15,50.02 R1.2 !INT!.P$2
  Bottom 0.203: v73.66,36.42 67.21,36.42 62.1,41.53 62.1,49.2 !INT!.P$2
$N36  (via drill 0.25 pad 0.66)
  Top 0.254: R35.2 43.31,73.2 43.64,73.53 v46.74,73.53 46.74,72.22 U6.1
  Top 0.305: CR7.1 72.39,69.85 v71.75,70.48 70.48,70.48 CR6.1 | C36.1 47.73,72.19 U6.1
  Bottom 0.305: v71.75,70.48 62.61,70.48 59.56,73.53 v46.74,73.53
$N99
  Top 1.143: J1.2 13.46,16.89 14.48,17.91 14.48,21.63 R57.2
BATT+  (via drill 0.51 pad 1.02)
  Top 0.305: U1.8 67.16,37.74 69.6,35.31 83.82,35.31 86.49,37.97 CR4.1
  Top 0.762: CR4.1 86.57,40.13 v88.77,40.13 | C20.1 93.05,40.13 v91.06,40.13 | R17.2 93.98,44.75 v93.98,43.18 | R18.2 v98.81,43.18
  Top 1.143: R57.1 11.19,23.86 BATT+.P$1
  pour PWR+Signal: 88.9,47.62 101.09,47.62 101.09,32.26 18.54,32.26 18.54,22.23 8.89,22.23 8.89,33.02 14.99,33.02 14.99,35.56 25.27,35.56 25.27,37.97 63.5,37.97 63.5,64.77 70.1,64.77 70.1,82.04 77.34,82.04 77.34,59.69 68.58,59.69 68.58,42.55 88.9,42.55
BATT-
  Top 0.762: 3.68,16.89 3.56,16.89 | 1.91,21.51 R19.2
  Top 1.143: J1.1 3.68,16.89 | 3.56,16.89 1.91,18.54 1.91,21.51
BATT_THERM+  (via drill 0.25 pad 0.66)
  Top 0.254: R4.1 76.07,37.08 | 76.07,37.08 R9.2 | v76.33,36.2 76.33,36.83 76.07,37.08
  Top 0.508: THERM+.P$1 6.73,8.91 6.81,8.99 J1.3
  GND+Signal 0.508: v76.33,33.66 v76.33,36.2
  Bottom 0.508: v76.33,33.66 75.31,32.64 59.56,32.64 59.18,33.02 18.16,33.02 17.14,32 17.14,17.4 14.53,14.78 8.9,14.78 J1.3
BUFFOUT1  (via drill 0.25 pad 0.66)
  Top 0.254: U12.4 94.53,63.37 v93.73,63.37 | R41.1 98.39,65.28 v97.41,65.28 97.05,65.63 U12.1
  Bottom 0.254: v93.73,63.37 95.5,63.37 v97.41,65.28
BUFFOUT2  (via drill 0.25 pad 0.66)
  Top 0.254: U14.4 49.85,36.58 v49.15,36.58 | R47.1 53.5,38.73 53.59,38.73 53.59,38.86 v52.58,38.86 51.69,38.86 51.69,38.73 51.75,38.73 U14.1
  Bottom 0.254: v49.15,36.58 49.15,36.62 49.19,36.62 51.44,38.86 v52.58,38.86
BUFFOUT3  (via drill 0.25 pad 0.66)
  Top 0.254: U13.4 29.66,52.35 v28.96,52.35 | R44.1 33.31,54.61 v32.38,54.61 31.56,54.61 U13.1
  Bottom 0.254: v28.96,52.35 30.12,52.35 v32.38,54.61
BUFFOUT4  (via drill 0.25 pad 0.66)
  Top 0.254: U15.4 17.97,45.47 17.98,45.47 17.98,45.34 v17.27,45.34 | R50.1 21.81,47.62 v20.83,47.62 20.47,47.98 U15.1
  Bottom 0.254: v17.27,45.34 18.54,45.34 v20.83,47.62
CHRGR_SCL  (via drill 0.25 pad 0.66)
  Top 0.203: U17.34 57.35,56.44 57.53,56.26 57.53,55.88 60.07,53.34 60.07,52.63 R2.2 | v73.66,37.77 73.05,37.77 73.05,37.72 72.36,37.72 U1.13 | SCL.P$2 60.18,52.63
  Top 0.254: 60.18,52.63 R2.2
  Bottom 0.203: v73.66,37.77 72.95,37.77 72.77,37.59 66.8,37.59 62.74,41.66 62.74,49.02 62.74,51.16 SCL.P$2
CHRGR_SDA  (via drill 0.25 pad 0.66)
  Top 0.203: U17.35 57.74,56.94 58.04,56.64 58.04,56.13 60.63,53.54 62.33,53.54 SDA.P$2 61.92,51.31 R3.2 | v70.48,39.24 70.48,38.73 70.87,38.35 72.29,38.35 U1.14
  Bottom 0.203: SDA.P$2 63.25,41.91 65.91,39.24 v70.48,39.24
DCIN_MON  (via drill 0.25 pad 0.66)
  Top 0.203: 99.95,61.84 C42.1 | v53.72,52.58 52.32,52.58 52.05,52.85 U17.27 52.07,54.1 52.07,55.75 52.58,56.26 DCIN2AD.P$1
  Top 0.254: v99.95,56.39 99.95,61.84
  Top 0.305: DCINMON.P$1 99.69,64.14 99.35,63.79 R41.2 98.42,63.12 98.68,62.87 99.69,62.87 99.95,62.61 C42.1
  Bottom 0.254: v53.72,52.58 55.12,52.58 56.24,53.7 97.26,53.7 v99.95,56.39
DCIN_S  (via drill 0.25 pad 0.66, 0.36 pad 0.76, 0.51 pad 1.02)
  Top 0.203: U7.5 70.74,64.64 71.37,65.28 72.44,65.28 72.57,65.41
  Top 0.254: R10.2 93.5,70.38 v93.22,70.71
  Top 0.305: R20.2 68.89,45.27 69.34,45.72 78.74,45.72 79.25,45.21 80.56,45.21 C17.1 | R39.1 89.83,66.13 89.53,66.42 v89.53,67.06 | C39.1 72.57,65.41 72.57,65.58 75.18,68.2 75.82,68.2 76.45,68.83 CR7.2 77.47,69.85 78.11,69.22 DCIN_S.P$1
  Top 0.356: Q3.3 v89.53,67.06 | Q3.2 v88.27,67.06 | Q3.1 87,69.09 v85.6,69.09
  Top 0.406: Q1.8 v83.19,51.44 | Q1.7 v83.19,50.16 | Q1.6 v83.19,48.9 | Q1.5 v83.19,47.62
  Top 0.508: C17.1 81.92,44.37 | CR5.2 84.58,51.18 v84.58,52.58
  Top 0.762: 81.92,44.37 v81.92,46.35
  pour PWR+Signal: 80.01,71.63 80.01,43.81 87.63,43.81 87.63,66.04 93.98,66.04 93.98,71.63
GND  (via drill 0.25 pad 0.66, 0.3 pad 0.76, 0.36 pad 0.76, 0.51 pad 1.02, 0.76 pad 1.52)
  Top 0.203: 5VON.1 8.45,52.65 v8.89,53.09 | 43.94,59.44 45.16,59.44 U17.9 | C44.2 v32.44,51.18 33.29,51.18 C45.2 | U17.56 51.05,66.39 51.59,66.93 51.59,67.55 C52.2 | 57.53,59.94 U17.41 | U17.20 48.55,55.23 v48.54,55.37 | U17.25 51.05,52.86 50.72,52.53 50.72,52.21 C78.2 | C39.2 72.57,62.53 | U7.3 71.24,62.1 v71.88,62.1
  Top 0.254: 8.58,41.42 C23.2 | R10.1 91.9,68.83 91.57,68.5 v91.57,68.07 | C19.2 v65.15,45.47 | C9.2 61.59,38.82 61.59,38.86 v60.71,38.86 | C11.2 v56.9,40.26 | C13.2 60.21,42.8 v57.91,42.8 | U1.10 65.28,36.45 | U3.2 v60.45,33.53 60.45,32.64 C15.2 | C8.2 68.07,34.45 v68.07,33.78 | C12.2 75.73,39.71 v75.74,39.75 | R21.2 89.92,43.76 v89.97,43.76 | 25.91,69.85 25.39,69.85 U5.5 | 25.91,69.85 25.91,70.38 U5.6 | 25.91,69.85 v26.54,69.85 | R45.2 48.01,37.52 v48.9,37.52 | C46.2 51.85,35.31 v52.63,35.31 53.62,35.31 C47.2 | R61.1 v38.86,34.04 | C51.2 41.16,57.92 41.73,58.5 41.73,58.91 C50.2 41.76,58.94 v41.76,59.64 43.74,59.64 43.94,59.44 | U4.2 28.57,41.05 | 28.57,41.05 | 28.57,41.05 28.57,40.87 28.27,40.56 28.27,40.55 U4.6 | R43.2 v28.74,53.25 v28.75,53.26 | C26.2 59.85,59.42 59.33,59.94 57.53,59.94 | Q9.2 19.43,66.29 19.43,66.04 v20.27,66.04 | R58.1 v16.64,67.77 | PICPWR.1 v55.63,66.93 | v71.88,62.1 72.1,62.1 C39.2 | C4.2 45.1,68.16 45.85,68.91 v45.85,70.99 | v45.85,70.99 U6.2 | C36.2 47.87,70.42 47.3,70.99 v45.85,70.99 | 35.98,48.25 C5.2
  Top 0.305: U1.16 74.11,39.7 74.3,39.88 75.62,39.88 v75.74,39.75 | R24.2 33.6,67.51 33.27,67.18 v33.27,66.55 | C28.2 21.59,71.88 | 21.59,71.88 v20.83,71.88 | C27.2 21.59,71.88 | Q7.2 19.43,60.2 v20.45,60.2 20.45,59.05 19.81,58.42 R37.1 | R40.2 v92.58,66.93 95.25,66.93 95.5,66.67 U12.2 | C41.2 v97.41,61.59 98.18,61.59 C42.2 | U14.2 50.8,40.64 51.18,41.02 v51.82,41.02 | Q10.2 42.61,36.83 v43.18,36.83 | v30.23,40.82 29.97,40.56 28.07,40.56 U4.6 26.2,40.55 v25.93,40.82 | R11.2 R6.2 v30.73,43.87 | R22.2 v26.54,46.89 | C1.2 v30.15,47.5 | C3.2 32.05,47.5 32.05,48.06 v30.99,48.06 | C48.2 v20.8,44.07 21.18,44.45 C49.2 | R48.2 16.37,46.25 v17.02,46.25 | U15.2 18.92,49.23 18.62,49.53 v16,49.53 | U13.2 30.61,56.16 30.25,56.52 v28.7,56.52 | C52.2 51.6,68.11 51.92,68.43 51.92,68.95 C53.2 52.17,69.22 v52.17,70.23 | C26.2 59.85,57.85 60.12,57.58 60.12,57.09 C77.2 60.45,56.77 v60.45,55.73 | C78.2 49.97,51.33 C79.2 50,50.41 49.99,49.84 v49.99,49.4 | C16.2 64.86,35.27 v65.28,35.69 | Q11.2 61.92,71.37 v61.92,69.98 R25.1 | 12VON.1 v4.83,34.8 | C2.2 v29.46,34.67 | R30.2 35.98,48.25
  Top 0.356: 90.81,68.07 v91.57,68.07
  Top 0.406: Q3.4 90.81,68.07 | 65.28,36.45 v65.28,35.69 | Q2.1 v65.66,51.44 | Q2.2 v65.66,50.16 | Q2.3 v65.66,48.9 | C43.2 v11.05,55.88 | C6.2 98.55,70.08 v99.49,71.02 | C7.2 93.48,77.43 GND.P$1
  Top 0.508: C23.2 8.05,41.91 v7.24,41.91 | C24.2 8.05,38.73 v7.24,38.73 | C25.2 8.05,35.56 v7.24,35.56 | C21.2 v24.13,42.6 | U5.13 24.38,71.88 v24,71.5
  Top 0.762: GND.P$1 93.07,78.21 92.38,77.52 91.01,77.52 90.17,78.36 | R54.2 v12.83,47.62 | C17.2 81.41,37.08 v83.95,37.08 | v35.31,66.55 35.31,64.71 C31.2 33.27,64.71 v33.27,66.55 | C30.2 25.65,64.71 v25.65,66.55 25.65,64.52 27.69,64.52 v27.69,66.55 | R7.2 1.73,77.19 v1.73,75.82 | R14.2 v99.49,71.02 | R51.2 v89.41,34.92 | C5.2 C3.2 | C20.2 v97.54,40.26 | CR2.1 65.23,57.89 65.2,57.91 v63.48,57.91 | R53.2 6.73,2.56 THERM-.P$1 | R52.2 1.78,24.38 2.79,23.37 v3.94,23.37 | C33.2 21.01,76.12 20.19,75.31 v19.43,75.31
  Top 1.016: 90.17,78.36 90.17,80.26
  Top 1.143: v3.94,23.37 3.94,21.59 R19.1
  Bottom 0.762: 90.14,78.36 90.91,77.6 92.48,77.6 93.07,78.18 GND.P$1
  Bottom 1.016: 90.14,78.36 J2.2
  other vias: 24,72.26 25.27,72.26 25.27,71.5
  pour GND+Signal (isolate 0.051): 101.09,82.04 0.51,82.04 0.51,0.51 18.54,0.51 18.54,32.26 101.09,32.26
IB_PWR_5V  (via drill 0.36 pad 0.76)
  Top 0.406: v6.1,57.78 Q5.8 7.11,57.78 7.11,56.26 7.49,55.88 7.62,55.88 | Q5.7 v6.1,59.05 | Q5.6 v6.1,60.33 | Q5.5 v6.1,61.59 | C43.1 7.62,55.88 | 7.62,55.88 5VIB.P$1
  pour PWR+Signal: 9.65,54.61 9.65,63.5 0.51,63.5 0.51,54.61
IB_PWR_EN  (via drill 0.25 pad 0.66)
  Top 0.203: U17.15 45.13,56.44 43.61,56.44 42.8,55.63 v42.04,55.63
  Top 0.254: R38.1 18.34,56.47 17.88,56.01 IBPWREN.P$1
  Bottom 0.254: IBPWREN.P$1 27.81,56.01 28.19,55.63 v42.04,55.63
IB_SPI_!SS  (via drill 0.25 pad 0.66)
  Top 0.203: 54.53,65.32 54.53,66.55 54.76,66.78 54.76,67.67
  Top 0.254: J4.6 4.5,71.81 5.08,72.39 !SPI_SS!.P$2 | 54.53,65.32 U17.49 | 54.76,67.67 v54.74,67.69
  GND+Signal 0.254: v40.01,69.09 54.1,69.09 54.74,68.45 v54.74,67.69
  Bottom 0.254: !SPI_SS!.P$2 16.64,72.39 20.07,69.09 v40.01,69.09
IB_SPI_MISO  (via drill 0.25 pad 0.66)
  Top 0.203: v53.03,66.73 53.03,65.32 U17.52
  Top 0.254: J4.4 4.57,66.8 5.08,67.31 MISO.P$2
  GND+Signal 0.254: v40.01,67.64 40.95,67.64 41.15,67.44 41.78,67.44 41.91,67.56 52.2,67.56 v53.03,66.73
  Bottom 0.254: MISO.P$2 10.16,67.31 12.06,69.22 18.16,69.22 19.68,67.69 v40.01,67.64
IB_SPI_MOSI  (via drill 0.25 pad 0.66)
  Top 0.203: v53.54,63.88 U17.51
  Top 0.254: J4.3 4.62,64.31 5.08,64.77 MOSI.P$2 | U17.51
  GND+Signal 0.254: v40.01,66.42 43.94,66.42 46.48,63.88 v53.54,63.88
  Bottom 0.254: MOSI.P$2 10.16,64.77 12.06,66.67 23.88,66.67 25.02,65.53 39.12,65.53 v40.01,66.42
IB_SPI_SCLK  (via drill 0.25 pad 0.66)
  Top 0.203: v53.59,68.33 53.59,67.74 54.05,67.28 U17.50
  Top 0.254: J4.5 4.55,69.32 5.08,69.85 SPI_CLK.P$2
  GND+Signal 0.254: v41.27,68.33 v53.59,68.33
  Bottom 0.254: SPI_CLK.P$2 10.16,69.85 10.54,70.23 18.03,70.23 19.94,68.33 v41.27,68.33
L1_OUT  (via drill 0.25 pad 0.66, 0.41 pad 1.02)
  Top 0.254: 35.71,39.98 L1.1
  Top 0.305: C14.1 34.54,35.81 35.69,36.96 L1.1 | U4.7 v30.68,40.01 v25.48,40.01
  Top 0.762: 35.71,40.51 v37.34,40.51
  Top 0.813: 35.71,39.98 35.71,40.51
  pour PWR+Signal: 25.02,41.91 38.35,41.91 38.35,39.24 25.02,39.24
LED_BLK_LEAD  (via drill 0.25 pad 0.66)
  Top 0.203: v71.83,64.39 71.24,64.39 U7.4
  Top 0.254: v57.91,67.56 57.53,67.94 57.53,73.41 56.26,74.68 54.74,74.68 53.95,75.46 J6.2 55.63,76.07 58.93,76.07 59.44,76.58 LEDBLK.P$1
  Bottom 0.254: v57.91,67.56 62.36,67.56 65.15,64.77 71.45,64.77 v71.83,64.39
LED_RED_LEAD  (via drill 0.25 pad 0.66)
  Top 0.203: v69.47,63.88 70.2,63.88 U7.6
  Top 0.254: v56.77,66.67 56.77,73.03 55.88,73.91 52.96,73.91 51.45,75.42 J6.1 49.78,76.07 46.74,76.07 46.1,76.71 LEDRED.P$1
  Bottom 0.254: v56.77,66.67 62.36,66.67 65.15,63.88 v69.47,63.88
N$1
  Top 0.203: U4.4 27.57,42.43 27.69,42.55 R5.1
N$2
  Top 0.254: C19.1 67.09,44.54 67.44,44.2 R20.1 | 65.35,41.66 U1.2
  Top 0.305: R20.1 68.02,42.62 67.06,41.66 65.35,41.66
N$3  (via drill 0.25 pad 0.66)
  Top 0.305: U1.18 73.63,40.99 v73.66,41.02 | v76.58,46.74 76.58,47.56 Q1.4
  PWR+Signal 0.305: v73.66,41.02 76.58,43.94 v76.58,46.74
N$4
  Top 0.305: R5.2 27.69,47.49 C1.1
N$5
  Top 0.203: U1.12 74.61,37.09
  Top 0.254: 74.61,37.09 R4.2
N$6
  Top 0.203: U4.3 28.07,42.24 R6.1
N$7
  Top 0.203: U4.10 27.56,38.39 27.56,37.03 28.07,36.52 28.11,36.52 C2.1
N$8
  Top 0.203: U4.1 29.07,42.09 R11.1
N$9
  Top 0.203: RG0.P$1 41.91,62.43 U17.3
N$10
  Top 0.254: C9.1 63.48,39.7 U1.5
N$11
  Top 0.254: R8.2 62.75,40.34 U1.4
N$12
  Top 0.254: C11.1 R8.1
N$13
  Top 0.254: U1.15 74.58,39.05
  Top 0.305: 74.58,39.05 C12.1
N$14
  Top 0.254: CR4.2 86.36,43.89 86.36,48.39 86.74,48.77 88.12,48.77 Q4.3
N$15
  Top 0.254: 58.17,46.31 CR1.2
  Top 0.305: R16.2 58.8,43.56 58.17,44.2 58.17,46.31
N$16  (via drill 0.25 pad 0.66)
  Top 0.305: U1.17 v70.98,40.34 v70.97,40.34 | v65.68,47.6 67.21,47.6 67.22,47.65 Q2.4
  GND+Signal 0.305: v70.97,40.34 67.26,44.04 67.26,46.02 v65.68,47.6
N$17  (via drill 0.25 pad 0.66)
  Top 0.254: C18.1 72.01,44.2 72.26,43.94 72.26,42.37 U1.20
  Top 0.305: CR1.1 v64.14,46.35 | v71.37,44.96 71.37,44.23 C18.1
  Bottom 0.305: v64.14,46.35 70.74,46.35 71.37,45.72 v71.37,44.96
N$18
  Top 1.27: L2.2 85.83,65.3 89.79,61.34 89.79,57.35 CR3.1
N$19  (via drill 0.25 pad 0.66)
  Top 0.203: v30.12,38.25 29.07,38.25 U4.13
  Top 0.254: C14.2 30.73,35.81 v30.12,36.42
  Bottom 0.254: v30.12,36.42 v30.12,38.25
N$20  (via drill 0.25 pad 0.66)
  Top 0.203: U4.9 27.08,38.4 27.08,37.47 26.8,37.19 R12.2 26.78,36.36
  Top 0.254: 26.78,36.36 26.74,36.32 v26.04,36.32 25.31,36.32 C22.2 | v21.72,41.53 Q6.4
  Bottom 0.254: v26.04,36.32 22.61,39.75 22.61,40.64 v21.72,41.53
N$21
  Top 0.254: Q4.1 87.25,46.69 87.25,45.85 87.63,45.47 88.27,45.47 89.1,44.63 R21.1 89.23,44.7 89.79,44.7 91.06,45.97 91.06,49.53 89.41,51.18 CR5.1
N$22
  Top 0.254: Q8.4 60.96,73.59 Q11.3 60.93,73.41 R27.1
N$23
  Top 0.203: R31.2 18.87,71.4 19.41,70.87 20.42,70.87 21.08,70.21 21.58,70.21 C27.1
  Top 0.254: C27.1 21.59,70.25 23.37,70.25 23.37,70.23 U5.1
N$24
  Top 0.203: U4.5 27.07,42.48 R22.1
  Top 0.254: R13.2 R22.1
N$28  (via drill 0.25 pad 0.66)
  Top 0.254: U5.12 23.14,73.38 v22.73,73.79 | v28.45,71.37 27.72,71.37 C32.2
  Bottom 0.254: v22.73,73.79 26.04,73.79 v28.45,71.37
N$29
  Top 0.254: R23.2 R24.1 34.47,68.78 34.16,69.09 25.27,69.09 24.89,69.47 U5.4 | C29.2 35.65,68.18
  Top 0.305: 35.65,68.18 R23.2
N$30
  Top 0.203: R56.1 5.71,51.49 5VON.2
N$32
  Top 0.254: R35.1 43.31,71.73 44.9,71.73 U6.3
N$33
  Top 0.254: R28.2 R25.2 60.35,68.58 59.99,68.94 59.99,71.36 Q11.1
N$37
  Top 0.203: RG1.P$1 41.99,61.57 42.34,61.92 45.15,61.92 U17.4
N$38  (via drill 0.25 pad 0.66)
  Top 0.203: v47.14,56.95 U17.14
  GND+Signal 0.254: RF4.P$1 42.29,54.74 43.16,54.74 45.36,56.95 v47.14,56.95
N$40
  Top 0.254: Q5.4 15.88,61.59 | R36.1 15.68,60.89 15.88,61.09 15.88,61.59 | Q7.3 16.4,62.12 15.88,61.59
N$41
  Top 0.254: R38.2 R37.2 17.47,60.44 Q7.1
N$42
  Top 0.254: R39.2 R40.1 93.38,64.68 93.6,64.9 93.6,65.28 93.85,65.53 94.45,65.53 U12.3
N$43
  Top 0.254: R42.2 R43.1 28.72,54.7 29.06,55.04 29.61,55.04 U13.3
N$44
  Top 0.254: R46.2 R45.1 48.73,38.83 49.15,39.24 49.83,39.24 U14.3
N$45
  Top 0.254: R49.2 R48.1 16.85,47.46 17.27,47.88 17.87,47.88 U15.3
N$46
  Top 0.203: RC7.P$1 55.5,52.15 54.56,53.09 54.56,54.07 U17.32
N$58
  Top 0.762: PTH1.P$1 R7.1
N$59
  Top 0.762: PTH2.P$1 98.4,76.2 98.4,75.78 R14.1
N$60
  Top 0.762: PTH3.P$1 R51.1
N$61
  Top 0.762: R52.1 1.78,26.8 PTH4.P$1
N$62
  Top 0.762: R53.1 10.92,1.91 12.19,3.17 PTH5.P$1
N$63
  Top 0.305: R55.2 3.68,29.84 4.83,30.99 12VON.2
N$64
  Top 0.254: PICPWR.2 R26.1
N$65
  Top 0.254: Q9.1 17.46,66.04 16.13,66.04 15.85,66.32 R58.2 R60.2
N$66
  Top 0.254: U5.3 24.38,69.09 23.04,67.75 R59.1 21.03,67.75 20.19,68.58 18.41,68.58 Q9.3
N$67  (via drill 0.25 pad 0.61, 0.25 pad 0.66)
  Top 0.203: v28.32,37.26 28.07,37.52 U4.11
  Top 0.254: R62.1 38.73,39.12 | R62.1 38.73,37.72 v37.47,36.45 | Q10.3 40.5,38.75 40.18,39.06 R62.1
  Bottom 0.254: v28.32,37.26 29.08,36.45 29.97,35.56 36.58,35.56 v37.47,36.45
N$68
  Top 0.254: Q10.1 40.44,37.08 R63.2 R61.2
PC_PWR_12V  (via drill 0.25 pad 0.66, 0.36 pad 0.76)
  Top 0.254: 11.74,41.4 C23.1
  Top 0.305: R49.1 14.39,46.01 13.34,44.96 v13.34,43.81 | Q6.5 v13.97,41.53 | Q6.6 v13.97,40.26 | Q6.7 v13.97,38.99 | Q6.8 v13.97,37.72 | R13.1 24.69,43.87 24.26,43.43 21.34,43.43 20.95,43.05 v17.65,43.05
  Top 0.508: C24.1 v12.95,38.23 | C25.1 11.68,35.05 11.68,35.18 v12.95,35.18 | R55.1 1.78,33.53 12V.P$1 | 11.74,41.4 v12.95,41.4
  Top 0.762: 12V.P$1 4.45,36.2 4.45,41.91 3.68,42.67 2.34,42.67 J5.1
  other vias: 16.51,40.89 18.16,40.89 18.16,39.62 16.51,39.62 16.51,38.35 18.16,38.35
  pour PWR+Signal: 0.51,34.29 13.72,34.29 13.72,36.83 18.54,36.83 18.54,44.32 0.51,44.32
PC_PWR_CHASSIS
  Top 0.762: R54.1 9.07,47.7 J5.3
PHASE1-2
  Top 0.254: U5.8 25.4,74.04 25.89,74.04 U5.7 27.69,73.38 27.69,72.52
  Top 0.305: 27.94,74.3 27.69,74.3 27.69,72.52 C32.1
  Top 0.762: L3.2 27.94,74.3
  pour Top: 25.32,74.8 28.45,74.8 28.45,73.15 26.29,73.15 26.29,73.91 25.32,73.91
PICKIT3_PGC  (via drill 0.25 pad 0.66)
  Top 0.203: v54.61,60.45 56.4,60.45 U17.42
  Bottom 0.254: 50.8,52.07 54.61,55.88 v54.61,60.45
  Bottom 0.305: PICKIT3.5 PICPGC.P$1 50.8,52.07
PICKIT3_PGD  (via drill 0.25 pad 0.66)  (1 unrouted)
  Top 0.203: v53.72,57.94 56.38,57.94 U17.37
  Bottom 0.254: v53.72,57.94 53.72,56.24 49.1,51.61 49.1,48.46 48.26,47.62 PICKIT3.4
PSW_MON
  Top 0.203: U17.24 50.55,53.09 48.77,51.31 PSW2AD.P$1
  Top 0.254: C47.1 55.09,35.45 55.09,36.3 54.86,36.52 53.82,36.52 53.59,36.75 R47.2 54.52,37.38 54.86,37.72 54.86,40.39 53.85,41.4 PSWMON.P$1
  PWR+Signal 0.254: PSWMON.P$1 48.39,42.8 46.99,44.2 PSW2AD.P$1
PSW_OUT  (via drill 0.25 pad 0.66, 0.36 pad 0.76)
  Top 0.254: R27.2 v63.37,75.23 | R46.1 45.43,37.38 44.96,37.85 v44.96,42.55
  Top 0.305: CR6.2 70.48,74.55 69.85,75.18 | 69.85,75.18 v67.94,75.18 | PSWOUT.P$1 73.91,75.18 69.85,75.18
  Top 0.356: Q8.1 v67.94,75.18 | Q8.2 v66.67,75.18 | Q8.3 v65.41,75.18
  GND+Signal 0.254: v60.33,65.91 60.33,72.19 v63.37,75.23
  Bottom 0.254: v44.96,42.55 50.16,42.55 52.07,44.45 52.07,48.64 52.7,49.28 52.7,52.96 55.5,55.75 55.5,61.09 v60.33,65.91
  pour PWR+Signal: 62.87,81.92 62.87,73.66 68.83,73.66 68.83,82.04
REF_4.096V  (via drill 0.25 pad 0.66)
  Top 0.254: U3.4 62.26,37.09 C16.1 63.54,36.36 64.26,37.08 65.32,37.08 U1.9 | 66.93,34.71 C8.1 | U1REF.P$1 70.13,33.78 68.58,35.33 v66.93,35.33
  Top 0.305: U1.9 66.54,37.09 66.93,36.7 v66.93,35.33 66.93,34.71 | v78.74,37.08 R9.1
  Bottom 0.305: v66.93,35.33 76.99,35.33 v78.74,37.08
STAT_LED_!RED!/GRN
  Top 0.203: U7.2 70.74,61.72 70.48,61.47 62.1,61.47 60.45,63.12 59.69,63.12 59.51,62.94 U17.47
STAT_LED_RED/!GRN!
  Top 0.203: U7.1 70.24,62.1 62.23,62.1 60.71,63.63 59.44,63.63 59.25,63.44 U17.48
U1_CS  (via drill 0.36 pad 0.76, 0.51 pad 1.02)
  Top 0.305: U1.7 67.9,38.4 v67.94,38.35
  Top 0.762: v93.47,52.58 93.47,50.88 R17.1 | R18.1 97.66,50.88 v97.66,52.58 96.95,53.29 CR3.2
  Bottom 0.305: v67.94,38.35 72.64,38.35 77.47,43.18 88.01,43.18 91.31,46.48 v91.31,51.56
  pour PWR+Signal: 88.9,54.61 101.09,54.61 101.09,48.9 88.9,48.9
U1_IOUT  (via drill 0.25 pad 0.66)
  Top 0.305: U1.1 63.88,42.3 v64.01,42.29 | v90.17,46.74 89.09,46.74 Q4.2
  Bottom 0.305: v64.01,42.29 65.66,43.94 87.38,43.94 v90.17,46.74
U1_LX  (via drill 0.25 pad 0.66, 0.36 pad 0.76, 0.51 pad 1.02)
  Top 0.254: U1.19 72.32,41.66 70.61,41.66 70.32,41.95 C18.2 70.32,44.92 v70.36,44.96
  Top 0.406: Q1.1 v75.06,51.44 | Q1.2 v75.06,50.16 | Q1.3 v75.06,48.9 | Q2.5 v73.79,47.62 | Q2.6 v73.79,48.9 | Q2.7 v73.79,50.16 | Q2.8 v73.79,51.44
  Top 0.762: CR2.2 v73.79,57.28 | L2.1 77.34,55.35 v77.34,55.37
  pour PWR+Signal: 69.85,58.42 69.85,43.81 78.74,43.81 78.74,58.42
U1_VL  (via drill 0.25 pad 0.66)
  Top 0.254: R16.1 62.66,42.23 C13.1 62.48,42.04 63.5,41.02 65.31,41.02 U1.3 66.7,40.99 67.06,40.64 67.06,39.4 66.7,39.04 65.43,39.04 U1.6 65.28,38.99 63.88,38.99 63.63,38.73 v63.63,38.35 | 61.42,34.54 U3.3 61.47,34.47 v61.47,33.53 | C15.1 61.47,32.61 v61.47,33.53 | U1VL.P$1 64.39,33.78 64.14,33.53 v61.47,33.53
  Bottom 0.254: v61.47,33.53 61.47,36.2 v63.63,38.35
U5_VDD
  Top 0.203: R31.1 19.74,73.13 20.17,73.56 21.58,73.56 C28.1
  Top 0.254: C28.1 21.59,74.17 21.97,74.55 23.5,74.55 23.88,74.17 23.88,73.39 U5.11
V_CHRGR  (via drill 0.36 pad 0.76)
  Top 0.406: Q3.5 v90.81,75.06 91.77,75.06 92.53,74.3 C6.1 94.98,74.33 C7.1 | Q3.6 v89.53,75.06 | Q3.7 v88.27,75.06 | Q3.8 v87,75.06
  Top 1.016: 87.66,78.36 J2.1
  Top 1.27: VCHRG.P$1 86.49,76.33 87.66,77.47 87.66,78.36
  Bottom 1.016: 87.66,78.36 J2.1
  Bottom 1.27: 87.66,78.36 87.66,77.47 86.49,76.33 VCHRG.P$1
  pour PWR+Signal: 83.31,72.9 91.69,72.9 91.69,82.04 83.31,82.04
VBAT_SW  (via drill 0.36 pad 0.76, 0.41 pad 1.02, 0.51 pad 1.02)
  Top 0.203: U4.12 28.57,37.96 29.21,37.31 | 32.38,38.25 L1.2
  Top 0.254: U5.9 24.89,74.05 24.64,74.3 24.39,74.05 U5.10 | 29.21,37.31 31.45,37.31 32.38,38.25 | 24.51,75.89 C33.1
  Top 0.305: R30.1 37.85,45.11 v37.36,44.63
  Top 0.356: Q8.8 v67.94,67.06 | Q8.7 v66.67,67.06 | Q8.6 v65.41,67.06 | Q8.5 v64.14,67.06
  Top 0.406: 24.64,74.3 24.64,75.69 24.51,75.89
  Top 0.762: 24.51,75.89 24.51,76.2 v25.65,76.2 | L1.2 C3.1 C5.1 | C5.1 | C5.1 v37.36,44.63
  GND+Signal 0.762: v41.55,72.72 33.1,72.75 29.11,72.75 v25.65,76.2
  Bottom 0.305: VBAT_SW.P$1 74.93,72.24 69.75,67.06 v67.94,67.06
  pour PWR+Signal: 31.37,49.53 31.37,43.18 46.48,43.18 46.48,67.31 60.96,67.31 60.96,66.04 68.83,66.04 68.83,72.39 61.59,72.39 61.59,73.66 40.64,73.66 40.64,49.53
VBATSW_EN  (via drill 0.25 pad 0.66)
  Top 0.203: U17.46 56.46,62.43 v60.05,62.43
  Top 0.254: R28.1 61.93,66.34 62.23,66.04 VBATSWEN.P$1
  Bottom 0.254: VBATSWEN.P$1 62.23,63.12 61.54,62.43 v60.05,62.43
VOUT_BOOST  (via drill 0.25 pad 0.66, 0.3 pad 0.76)
  Top 0.203: R12.1
  Top 0.254: C22.1 25.92,35.27 26.16,35.51 R12.1
  Top 0.305: C22.1 25.23,35.31 24.64,35.31 24.13,35.81 C21.1 24.59,38.61 25.27,38.61 26.12,39.45 U4.8 | Q6.1 v21.72,37.72 | Q6.2 v21.72,38.99 | Q6.3 v21.72,40.26
  Top 0.508: C21.1 24.13,38.35 | 24.13,38.35 | 24.13,38.35 22.76,38.35 v22.71,38.35
  pour PWR+Signal: 23.75,41.91 23.75,36.83 19.68,36.83 19.68,41.91
VPP_!MCLR!
  Top 0.203: 43.94,60.44 43.95,60.44 U17.7
  Top 0.254: 43.94,60.44 41.48,60.44 39.88,58.85 39.88,56.64 44.58,51.94 44.58,48.97 R15.2
  Top 0.305: R15.2 41.78,48.9 VPP!MCLR!.P$1
  Bottom 0.305: PICKIT3.1 VPP!MCLR!.P$1

## Text on the board
tPlace: (GND)
tNames: TransTech Systems, Inc | PCB: 1700-0003 REV-A | PCA: 7500-0430 REV-A
ENG_NOTES: PANEL / INDICATOR | PWR SW / & LED | CHARGER / POWER | IB+ PWR OUT / & COMM | PANEL PC / PWR OUT | PICKIT 3 / PRGM CONN | UPDATE CHECKLIST: / See Basecamp punch list ... / https://basecamp.com/2591377/projects/18383547/todolists/67793168 | BATTERY